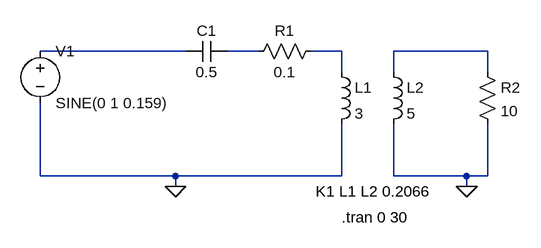
[diagram p0: schematic Draft1.asc]
Draft1.asc, the LTspice schematic file:
Version 4.1
SHEET 1 880 680
WIRE 48 32 -176 32
WIRE 160 32 112 32
WIRE 288 32 240 32
WIRE 512 32 368 32
WIRE 288 64 288 32
WIRE 368 64 368 32
WIRE 512 64 512 32
WIRE -176 224 -176 112
WIRE 32 224 -176 224
WIRE 288 224 288 144
WIRE 288 224 32 224
WIRE 368 224 368 144
WIRE 480 224 368 224
WIRE 512 224 512 144
WIRE 512 224 480 224
WIRE 32 240 32 224
WIRE 480 240 480 224
FLAG 32 240 0
FLAG 480 240 0
SYMBOL voltage -176 16 R0
WINDOW 123 0 0 Left 0
WINDOW 39 0 0 Left 0
SYMATTR InstName V1
SYMATTR Value SINE(0 1 0.159)
SYMBOL cap 112 16 R90
WINDOW 0 0 32 VBottom 2
WINDOW 3 32 32 VTop 2
SYMATTR InstName C1
SYMATTR Value 0.5
SYMBOL res 256 16 R90
WINDOW 0 0 56 VBottom 2
WINDOW 3 32 56 VTop 2
SYMATTR InstName R1
SYMATTR Value 0.1
SYMBOL ind 272 48 R0
SYMATTR InstName L1
SYMATTR Value 3
SYMATTR Type ind
SYMATTR SpiceLine Rser=1m
SYMBOL ind 352 48 R0
SYMATTR InstName L2
SYMATTR Value 5
SYMATTR Type ind
SYMATTR SpiceLine Rser=1m
SYMBOL res 496 48 R0
SYMATTR InstName R2
SYMATTR Value 10
TEXT 248 248 Left 2 !K1 L1 L2 0.2066
TEXT 288 288 Left 2 !.tran 0 30

The netlist it stands for:
* Draft1.asc
V1 N001 0 SINE(0 1 0.159)
C1 N002 N001 0.5
R1 N003 N002 0.1
L1 N003 0 3 Rser=1m
L2 N004 0 5 Rser=1m
R2 N004 0 10
K1 L1 L2 0.2066
.tran 0 30
.backanno
.end